# Altium schematic sheet Actuator_Section.SchDoc
size A; DocumentNumber: 10; SheetNumber: 10; SheetTotal: 13
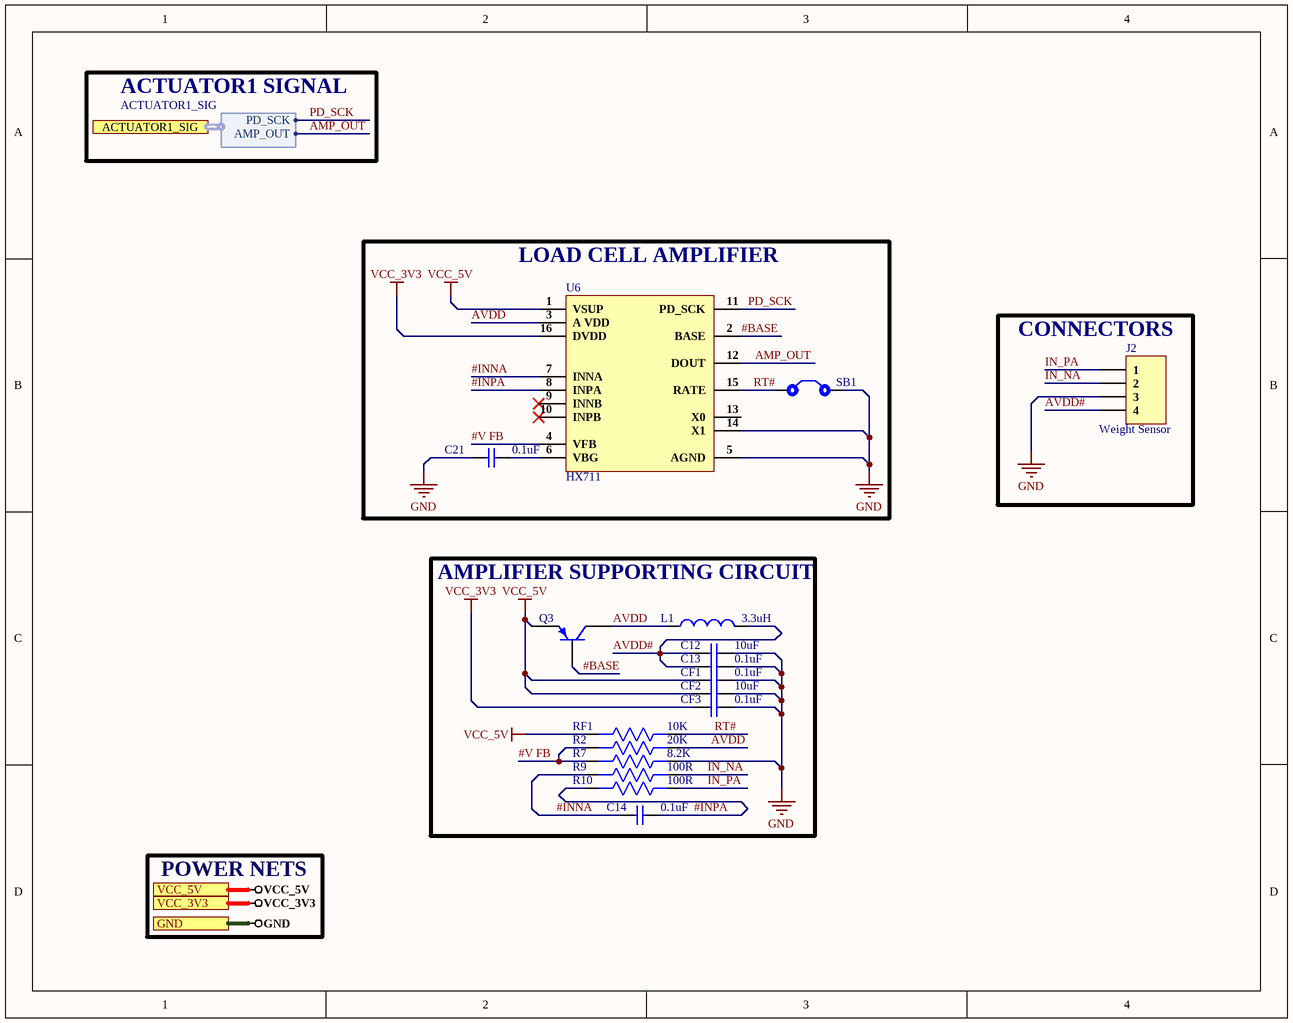
[diagram p0: Actuator_Section.SchDoc]

## Parts
C12  10uF  [CAP-0603]
C13  0.1uF  [CAP-0603]
C14  0.1uF  [CAP-0603]
C21  0.1uF  [CAP-0603]
CF1  0.1uF  [CAP-0603]
CF2  10uF  [CAP-0603]
CF3  0.1uF  [CAP-0603]
J2  Weight Sensor  [B4B-XH-A(LF)(SN)]
L1  3.3uH  [74437368033]
Q3  MMBT4403LT1G  [sot-23]  (value not drawn)
R2  20K  [RES-0603]
R7  8.2K  [RES-0603]
R9  100R  [RES-0603]
R10  100R  [RES-0603]
RF1  10K  [RES-0603]
SB1  Solder Bridge  [Solder Bridge]  (value not drawn)
U6  HX711  [HX711]

## Blocks framed on the sheet
LOAD CELL AMPLIFIER: C21 SB1 U6
CONNECTORS: J2
AMPLIFIER SUPPORTING CIRCUIT: C12-C14 CF1-CF3 L1 Q3 R2 R7 R9 R10 RF1

## Ports
ACTUATOR1_SIG (harness ACTUATOR1_SIG), GND, VCC_3V3, VCC_5V

## Harnesses
ACTUATOR1_SIG: PD_SCK, AMP_OUT

## Nets
GND: C12.2 C13.2 C21.1 CF1.2 CF2.2 CF3.2 J2.3 R7.1 SB1.2 U6.5(AGND) U6.14(X1) ; port GND
VCC_3V3: CF3.1 U6.16(DVDD) ; port VCC_3V3
VCC_5V: CF1.1 CF2.1 Q3.2(E) RF1.2 U6.1(VSUP) ; port VCC_5V
#BASE: Q3.1(B) U6.2(BASE)
#INNA: C14.1 R9.2 U6.7(INNA)
#INPA: C14.2 R10.2 U6.8(INPA)
#V FB: R2.2 R7.2 U6.4(VFB)
AMP_OUT: U6.12(DOUT) ; port ACTUATOR1_SIG.AMP_OUT
AVDD: L1.1 Q3.3(C) R2.1 U6.3(A_VDD)
AVDD#: C12.1 C13.1 J2.4 L1.2
IN_NA: J2.2 R9.1
IN_PA: J2.1 R10.1
PD_SCK: U6.11(PD_SCK) ; port ACTUATOR1_SIG.PD_SCK
RT#: RF1.1 SB1.1 U6.15(RATE)
NetC21_2: C21.2 U6.6(VBG)

Not connected (* = marked no-connect by the designer): U6 9(INNB)* 10(INPB)* 13(X0)

## Notes on the sheet
- ACTUATOR1 SIGNAL
- POWER NETS

## Library data of the parts
C12 CF2 = TMK107BBJ106MA-T: CAP CER 10UF 25V X5R 0603; Manufacturer: Taiyo Yuden; Tolerance: 20%; Supplier 1: Digi-Key; Manufacturer Part Number: TMK107BBJ106MA-T; Stock 1: 85333; Pricing 1: 1=0.46, 10=0.32, 50=0.2238, 100=0.1918, 500=0.14386, 1000=0.12149 (USD); Mount: Surface Mount; Case/Package: 0603; Case Code (Imperial): 0603; Case Code (Metric): 1608; Min Operating Temperature: -55°C; Max Operating Temperature: 85°C; Packaging: Tape and Reel; Capacitance: 10uF; Voltage Rating: 25V; Lead Free: Lead Free; RoHS Compliant: Yes; ComponentLink1URL: http://ds.yuden.co.jp/TYCOMPAS/ut/detail.do?productNo=TMK107BBJ106MA-T&fileName=TMK107BBJ106MA-T_SS&mode=specSheetDownload&src-supplier=Digi-Key; ComponentLink1Description: http://ds.yuden.co.jp/TYCOMPAS/ut/detail.do?productNo=TMK107BBJ106MA-T&fileName=TMK107BBJ106MA-T_SS&mode=specSheetDownload&src-supplier=Digi-Key; Supplier Part Number 1: 587-6023-1-ND
C13 C14 C21 CF1 CF3 = CL10B104KB8NNNL: CAP CER 0.1UF 50V X7R 0603; Manufacturer: Samsung; Capacitance: 100nF; Tolerance: 10%; Supplier 1: Digi-Key; Manufacturer Part Number: CL10B104KB8NNNL; Stock 1: 3731229; Pricing 1: 1=0.1, 10=0.03, 50=0.0164, 100=0.0134, 500=0.00958, 1000=0.00753, 2500=0.00684, 5000=0.0063 (USD); Mount: Surface Mount; Case/Package: 0603; Min Operating Temperature: -55°C; Max Operating Temperature: 125°C; Dielectric: X7R; Packaging: Tape and Reel; Package Quantity: 15000; Voltage Rating: 50V; Voltage Rating (DC): 50V; Series: CL; Construction: Flat; Length: 1.6mm; Width: 0.031inch; Height: 0.8mm; Thickness: 0.035inch; Depth: 0.8mm; Radiation Hardening: No; RoHS Compliant: Yes; ComponentLink1URL: https://www.verical.com/server-webapp/html/getDatasheet?partID=357523&src-supplier=Verical; ComponentLink1Description: https://www.verical.com/server-webapp/html/getDatasheet?partID=357523&src-supplier=Verical; ComponentLink2URL: https://media.digikey.com/pdf/Data%20Sheets/Samsung%20PDFs/CL_Series_MLCC_ds.pdf?src-supplier=Digi-Key; ComponentLink2Description: https://media.digikey.com/pdf/Data%20Sheets/Samsung%20PDFs/CL_Series_MLCC_ds.pdf?src-supplier=Digi-Key; Supplier Part Number 1: 1276-CL10B104KB8NNNLCT-ND
J2 = B4B-XH-A(LF)(SN): CONN HEADER VERT 4POS 2.5MM; Manufacturer: JST; Current Rating: 3A; Contact Resistance: 20mR; Voltage Rating (AC): 250V; Number of Positions: 4; Insulation Resistance: 1GR; Connector Type: Male Pin; Gender: Male; Wire/Cable Gauge: 22AWG; Supplier 1: Digi-Key; Manufacturer Part Number: B4B-XH-A(LF)(SN); Stock 1: 0; Mount: Through Hole; Contact Material: Brass; Contact Plating: Tin,Copper,Lead; Color: Natural; Housing Color: White; Housing Material: Polyamide; Material: Polyamide; Min Operating Temperature: -25°C; Max Operating Temperature: 85°C; Number of Rows: 1; Max Current Rating: 3A; Package Quantity: 500; Packaging: Bulk; Voltage Rating: 250V; Termination: Press-Fit; Max Voltage Rating (AC): 250V; Max Voltage Rating (DC): 250V; Number of Contacts: 4; Orientation: Straight; Series: XH; Contact Type: Male Pin; Length: 12.4mm; Pitch: 2.5mm; Lead Pitch: 2.5mm; Depth: 5.75mm; REACH SVHC: No SVHC; Lead Free: Lead Free; ComponentLink1URL: http://www.jst-mfg.com/product/pdf/eng/eXH.pdf?src-supplier=Digi-Key; ComponentLink1Description: http://www.jst-mfg.com/product/pdf/eng/eXH.pdf?src-supplier=Digi-Key; ComponentLink2URL: https://www.verical.com/server-webapp/html/getDatasheet?partID=640571&src-supplier=Verical; ComponentLink2Description: https://www.verical.com/server-webapp/html/getDatasheet?partID=640571&src-supplier=Verical; ComponentLink3URL: http://www.jst-mfg.com/product/pdf/eng/eXH.pdf?src-supplier=Future+Electronics; ComponentLink3Description: http://www.jst-mfg.com/product/pdf/eng/eXH.pdf?src-supplier=Future+Electronics; ComponentLink4URL: https://www.verical.com/server-webapp/html/getDatasheet?partID=455616&src-supplier=Verical; ComponentLink4Description: https://www.verical.com/server-webapp/html/getDatasheet?partID=455616&src-supplier=Verical; Supplier Part Number 1: 455-2249-ND
L1 = 74437368033: FIXED IND 3.3UH 8A 11.8 MOHM SMD; Manufacturer: Wurth Electronics; Core Material: Ferrite,Composite; Tolerance: 20%; Saturation Current: 23A; Shielding: Shielded; Self Resonant Frequency: 22MHz; DC Resistance (DCR): 11.8mR; Test Frequency: 100kHz; ComponentLink1URL: http://www.farnell.com/datasheets/1735871.pdf?src-supplier=Element14; ComponentLink1Description: http://www.farnell.com/datasheets/1735871.pdf?src-supplier=Element14; ComponentLink2URL: http://www.mouser.com/ds/2/445/74437368022-538992.pdf?src-supplier=Mouser; ComponentLink2Description: http://www.mouser.com/ds/2/445/74437368022-538992.pdf?src-supplier=Mouser; ComponentLink3URL: http://katalog.we-online.de/pbs/datasheet/74437368022.pdf?src-supplier=Digi-Key; ComponentLink3Description: http://katalog.we-online.de/pbs/datasheet/74437368022.pdf?src-supplier=Digi-Key; ComponentLink4URL: http://documents.rs-components.com/techlib://itc_doclist_GB.htm?stockno=7568629&src-supplier=RSComponents; ComponentLink4Description: http://documents.rs-components.com/techlib://itc_doclist_GB.htm?stockno=7568629&src-supplier=RSComponents; ComponentLink5URL: http://www.produktinfo.conrad.com/datenblaetter/1000000-1099999/001087607-da-01-ml-WE_LHMI_SMD_SPEICHERDROSSEL_744373_de_en.pdf?src-supplier=Conrad; ComponentLink5Description: http://www.produktinfo.conrad.com/datenblaetter/1000000-1099999/001087607-da-01-ml-WE_LHMI_SMD_SPEICHERDROSSEL_744373_de_en.pdf?src-supplier=Conrad; Supplier 1: Digi-Key; Manufacturer Part Number: 74437368033; RoHS: Yes; Category: Fixed Inductors; Stock 1: 1240; Pricing 1: 1=2.41000, 10=2.35900, 50=2.17700, 100=1.99600, 250=1.90500 (USD); Mount: Surface Mount; Case/Package: Nonstandard; Min Operating Temperature: -40°C; Max Operating Temperature: 125°C; Inductance Tolerance: 20%; Package Quantity: 500; Current Rating: 8A; Packaging: Tape and Reel; Resistor Type: Wirewound; Inductance: 3.3uH; Max DC Current: 8A; Termination: SMD/SMT; RMS Current (Irms): 8A; Series: WE-LHMI; Frequency: 22MHz; Series Resistance: 11.8MR; Length: 11mm; Width: 10mm; Height: 3.8mm; Height - Seated (Max): 0.157inch; Depth: 10mm; REACH SVHC: Unknown; RoHS Compliant: Yes; ComponentLink6URL: https://datasheet.ciiva.com/7354/74437368033-7354466.pdf?src-supplier=Newark; ComponentLink6Description: https://datasheet.ciiva.com/7354/74437368033-7354466.pdf?src-supplier=Newark; ComponentLink7URL: https://datasheet.ciiva.com/7691/1735872-7691596.pdf?src-supplier=Element14; ComponentLink7Description: https://datasheet.ciiva.com/7691/1735872-7691596.pdf?src-supplier=Element14; ComponentLink8URL: https://datasheet.ciiva.com/4961/74437368033-89775-4961151.pdf?src-supplier=Mouser; ComponentLink8Description: https://datasheet.ciiva.com/4961/74437368033-89775-4961151.pdf?src-supplier=Mouser; ComponentLink9URL: https://datasheet.ciiva.com/6693/74437368033-6693468.pdf?src-supplier=Digi-Key; ComponentLink9Description: https://datasheet.ciiva.com/6693/74437368033-6693468.pdf?src-supplier=Digi-Key; ComponentLink10URL: https://datasheet.ciiva.com/6693/74437368033-6693470.pdf?src-supplier=Digi-Key; ComponentLink10Description: https://datasheet.ciiva.com/6693/74437368033-6693470.pdf?src-supplier=Digi-Key; ComponentLink11URL: https://datasheet.ciiva.com/6693/74437368033-6693471.pdf?src-supplier=Digi-Key; ComponentLink11Description: https://datasheet.ciiva.com/6693/74437368033-6693471.pdf?src-supplier=Digi-Key; ComponentLink12URL: https://datasheet.ciiva.com/48690/001087608-da-01-ml-we-lhmi-smd-speicherdrossel-744373-de-en-48690487.pdf?src-supplier=Conrad; ComponentLink12Description: https://datasheet.ciiva.com/48690/001087608-da-01-ml-we-lhmi-smd-speicherdrossel-744373-de-en-48690487.pdf?src-supplier=Conrad; Supplier Part Number 1: 732-3388-1-ND
Q3 = MMBT4403LT1G: TRANS PNP 40V 600MA SOT23-3; Manufacturer: ON Semiconductor; Max Power Dissipation: 300mW; hFE Min: 30; Emitter Base Voltage (VEBO): 5V; Transition Frequency: 200MHz; Collector Emitter Saturation Voltage: -750mV; Element Configuration: Single; Voltage Rating (DC): -40V; Current Rating: -600mA; Collector-emitter Voltage-Max: 750mV; Number of Elements: 1; ComponentLink1URL: http://www.onsemi.com/pub/Collateral/MMBT4403LT1-D.PDF?src-supplier=Avnet; ComponentLink1Description: http://www.onsemi.com/pub/Collateral/MMBT4403LT1-D.PDF?src-supplier=Avnet; ComponentLink2URL: http://www.onsemi.com/pub/Collateral/MMBT4403LT1-D.PDF?src-supplier=Digi-Key; ComponentLink2Description: http://www.onsemi.com/pub/Collateral/MMBT4403LT1-D.PDF?src-supplier=Digi-Key; Supplier 1: Avnet; Manufacturer Part Number: MMBT4403LT1G; RoHS: Yes; Category: BJTs; Stock 1: 25249; Pricing 1: 1=0.14200, 10=0.09900, 100=0.05400, 500=0.04300 (USD); Case/Package: SOT-23-3; Number of Pins: 3; Contact Plating: Tin,Matte; Min Operating Temperature: -55°C; Max Operating Temperature: 150°C; Packaging: Tape and Reel; Polarity: PNP; Collector Emitter Breakdown Voltage: 40V; Package Quantity: 1; Collector Emitter Voltage (VCEO): 40V; Max Collector Current: 600mA; Collector Base Voltage (VCBO): 40V; Power Dissipation: 300mW; Gain Bandwidth Product: 200MHz; Max Frequency: 200MHz; Series: -; Frequency: 200MHz; Max Breakdown Voltage: 40V; Length: 3.04mm; Width: 1.4mm; Height: 1.01mm; Radiation Hardening: No; Lead Free: Lead Free; REACH SVHC: No SVHC; RoHS Compliant: Yes; ComponentLink3URL: https://datasheet.ciiva.com/4722/mmbt4403lt1-d-101652-4722132.pdf?src-supplier=Mouser; ComponentLink3Description: https://datasheet.ciiva.com/4722/mmbt4403lt1-d-101652-4722132.pdf?src-supplier=Mouser; ComponentLink4URL: https://datasheet.ciiva.com/15138/getdatasheetpartid-44367-15138750.pdf?src-supplier=Verical; ComponentLink4Description: https://datasheet.ciiva.com/15138/getdatasheetpartid-44367-15138750.pdf?src-supplier=Verical; ComponentLink5URL: https://datasheet.ciiva.com/14546/70099534-14546501.pdf?src-supplier=Allied+Electronics; ComponentLink5Description: https://datasheet.ciiva.com/14546/70099534-14546501.pdf?src-supplier=Allied+Electronics; ComponentLink6URL: https://datasheet.ciiva.com/7972/mmbt4403lt1-d-7972391.pdf?src-supplier=Element14; ComponentLink6Description: https://datasheet.ciiva.com/7972/mmbt4403lt1-d-7972391.pdf?src-supplier=Element14; ComponentLink7URL: https://datasheet.ciiva.com/11198/mmbt4403lt1-d-11198713.pdf?src-supplier=Avnet; ComponentLink7Description: https://datasheet.ciiva.com/11198/mmbt4403lt1-d-11198713.pdf?src-supplier=Avnet; ComponentLink8URL: https://datasheet.ciiva.com/16478/mmbt4403lt1-d-16478554.pdf?src-supplier=Avnet+Asia; ComponentLink8Description: https://datasheet.ciiva.com/16478/mmbt4403lt1-d-16478554.pdf?src-supplier=Avnet+Asia; ComponentLink9URL: https://datasheet.ciiva.com/976/mmbt4403lt1-d-976347.pdf?src-supplier=Digi-Key; ComponentLink9Description: https://datasheet.ciiva.com/976/mmbt4403lt1-d-976347.pdf?src-supplier=Digi-Key; ComponentLink10URL: https://datasheet.ciiva.com/16396/mmbt4403lt1-d-16396635.pdf?src-supplier=Future+Electronics; ComponentLink10Description: https://datasheet.ciiva.com/16396/mmbt4403lt1-d-16396635.pdf?src-supplier=Future+Electronics; ComponentLink11URL: https://datasheet.ciiva.com/976/mmbt4403lt1-d-976348.pdf?src-supplier=Digi-Key; ComponentLink11Description: https://datasheet.ciiva.com/976/mmbt4403lt1-d-976348.pdf?src-supplier=Digi-Key; ComponentLink12URL: https://datasheet.ciiva.com/976/mmbt4403lt1-d-976349.pdf?src-supplier=Digi-Key; ComponentLink12Description: https://datasheet.ciiva.com/976/mmbt4403lt1-d-976349.pdf?src-supplier=Digi-Key; ComponentLink13URL: https://datasheet.ciiva.com/25998/mmbt4403lt1-d-25998110.pdf?src-supplier=Avnet+Europe; ComponentLink13Description: https://datasheet.ciiva.com/25998/mmbt4403lt1-d-25998110.pdf?src-supplier=Avnet+Europe; Supplier Part Number 1: 88H4792
R2 = ESR03EZPF2002: RES SMD 20K OHM 1% 1/4W 0603; Manufacturer: Rohm; Resistance: 20kR; Max Power Dissipation: 250mW; Temperature Coefficient: 100ppm/°C; Supplier 1: Digi-Key; Manufacturer Part Number: ESR03EZPF2002; Stock 1: 4737; Pricing 1: 1=0.13, 10=0.12, 100=0.046, 1000=0.02024, 2500=0.01748 (USD); Case/Package: 0603; Case Code (Metric): 1608; Case Code (Imperial): 0603; Min Operating Temperature: -55°C; Max Operating Temperature: 155°C; Package Quantity: 1; Tolerance: 1%; Packaging: Tape and Reel; Resistor Type: Thick Film; Number of Terminations: 2; Features: Automotive AEC-Q200; Series: ESR; Length: 0.063inch; Width: 0.031inch; Height: 0.022inch; RoHS Compliant: Yes; ComponentLink1URL: https://www.rohm.com/datasheet/ESR01MZPF/esr-e?src-supplier=Digi-Key; ComponentLink1Description: https://www.rohm.com/datasheet/ESR01MZPF/esr-e?src-supplier=Digi-Key; Supplier Part Number 1: RHM20.0KADCT-ND
R7 = ERJ-PA3J822V: RES SMD 8.2K OHM 5% 1/4W 0603; Manufacturer: Panasonic; Resistance: 8.2kR; Max Power Dissipation: 250mW; Temperature Coefficient: 200ppm/°C; Supplier 1: Digi-Key; Manufacturer Part Number: ERJ-PA3J822V; Stock 1: 19862; Pricing 1: 1=0.1, 10=0.09, 100=0.0345, 1000=0.01518, 2500=0.01311 (USD); Case/Package: 0603; Case Code (Metric): 1608; Case Code (Imperial): 0603; Min Operating Temperature: -55°C; Max Operating Temperature: 155°C; Packaging: Tape and Reel; Resistor Type: Thick Film; Number of Terminations: 2; Tolerance: 5%; Features: Automotive AEC-Q200; Length: 0.063inch; Width: 0.031inch; Height: 0.018inch; ComponentLink1URL: https://industrial.panasonic.com/cdbs/www-data/pdf/RDO0000/AOA0000C331.pdf?src-supplier=Digi-Key; ComponentLink1Description: https://industrial.panasonic.com/cdbs/www-data/pdf/RDO0000/AOA0000C331.pdf?src-supplier=Digi-Key; Supplier Part Number 1: P8.2KBZDKR-ND
R9 R10 = RCA0603100RFKEAHP: RES SMD 100 OHM 1% 1/4W 0603; Manufacturer: Vishay Dale; Max Power Dissipation: 250mW; Temperature Coefficient: 100ppm/°C; Supplier 1: Digi-Key; Manufacturer Part Number: RCA0603100RFKEAHP; Stock 1: 0; Case/Package: 0603; Case Code (Imperial): 0603; Case Code (Metric): 1608; Min Operating Temperature: -55°C; Max Operating Temperature: 155°C; Resistor Type: Thick Film; Features: Automotive AEC-Q200,Anti-Sulfur; Packaging: Tape and Reel; Resistance: 100R; Tolerance: 1%; Number of Terminations: 2; RoHS Compliant: Yes; ComponentLink1URL: http://www.vishay.com/docs/20067/rcahp.pdf?src-supplier=Digi-Key; ComponentLink1Description: http://www.vishay.com/docs/20067/rcahp.pdf?src-supplier=Digi-Key; Supplier Part Number 1: 541-3244-2-ND
RF1 = CRGH0603J10K: RES SMD 10K OHM 5% 1/5W 0603; Manufacturer: TE Connectivity Holsworthy; Resistance: 10kR; Temperature Coefficient: 100ppm/°C; Power Rating: 200mW; Voltage Rating: 50V; Number of Resistors: 1; ComponentLink1URL: http://www.farnell.com/datasheets/2167052.pdf?src-supplier=Element14; ComponentLink1Description: http://www.farnell.com/datasheets/2167052.pdf?src-supplier=Element14; ComponentLink2URL: https://www.rohm.com/datasheet/ESR01MZPF/esr-e?src-supplier=Digi-Key; ComponentLink2Description: https://www.rohm.com/datasheet/ESR01MZPF/esr-e?src-supplier=Digi-Key; Supplier 1: Digi-Key; Manufacturer Part Number: CRGH0603J10K; Stock 1: 85818; Pricing 1: 1=0.1, 10=0.049, 100=0.02, 1000=0.00899, 2500=0.0078 (USD); Mount: Surface Mount; Case/Package: 0603; Case Code (Imperial): 0603; Case Code (Metric): 1608; Min Operating Temperature: -55°C; Max Operating Temperature: 125°C; Tolerance: 5%; Packaging: Tape and Reel; Resistor Type: Thick Film,Power resistor; Number of Terminations: 2; Series: CRGH; Termination: Solder; Voltage Rating (DC): 50V; Resistance Tolerance: 5%; Technology: THICK FILM; Length: 1.6mm; Width: 0.8mm; Height: 0.45mm; Depth: 0.8mm; RoHS Compliant: Yes; REACH SVHC: No SVHC; ELV: Compliant; ComponentLink3URL: http://www.farnell.com/datasheets/2007183.pdf?src-supplier=Element14; ComponentLink3Description: http://www.farnell.com/datasheets/2007183.pdf?src-supplier=Element14; Supplier Part Number 1: A126394DKR-ND
SB1 = Solder Bridge: Solder Bridge ON
U6 = HX711: LOAD CELL AMP HX711; Manufacturer Part No: HX711; Package: SOP-16L